# Altium schematic sheet 03_MEDICION.SchDoc: Medición de tensión y corriente
size 420 x 297 mm; Address1: Hardware en IoT · 2026; SheetNumber: 3; SheetTotal: 6
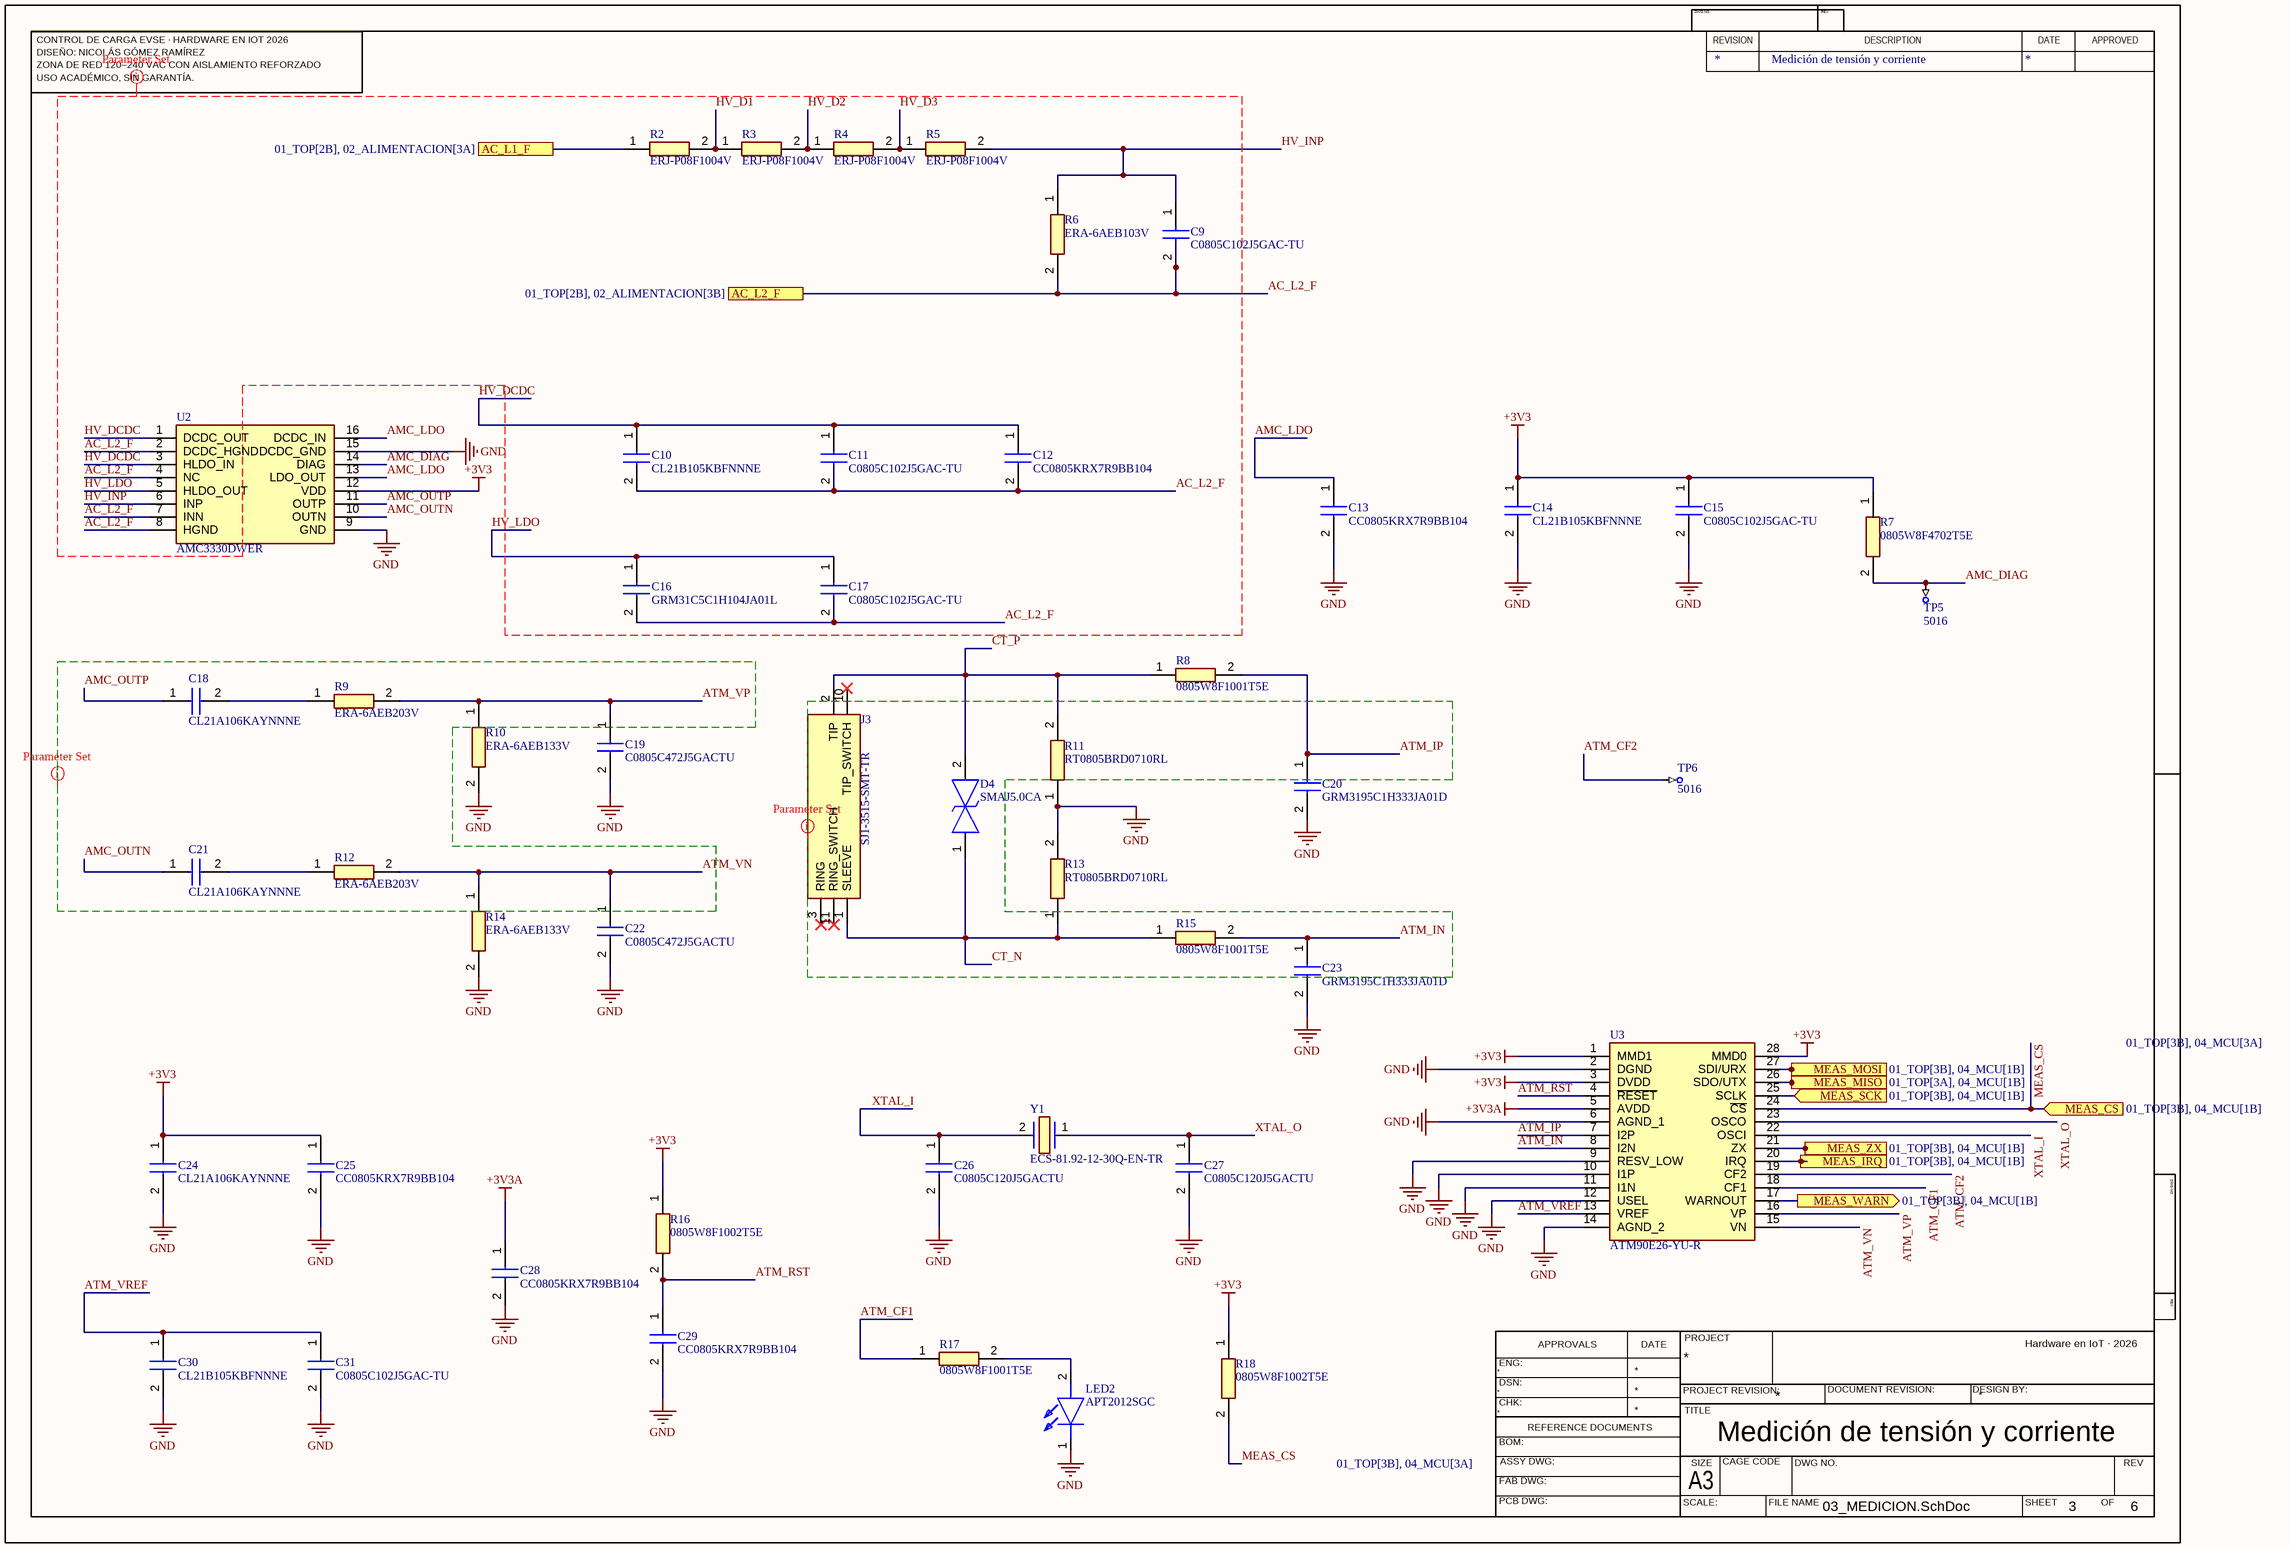
[diagram p0: 03_MEDICION.SchDoc]

## Parts
C9  C0805C102J5GAC-TU  [CAPC2012X88N]
C10  CL21B105KBFNNNE  [CAPC2012X88N]
C11  C0805C102J5GAC-TU  [CAPC2012X88N]
C12  CC0805KRX7R9BB104  [CAPC2012X88N]
C13  CC0805KRX7R9BB104  [CAPC2012X88N]
C14  CL21B105KBFNNNE  [CAPC2012X88N]
C15  C0805C102J5GAC-TU  [CAPC2012X88N]
C16  GRM31C5C1H104JA01L  [CAPC3216X180N]
C17  C0805C102J5GAC-TU  [CAPC2012X88N]
C18  CL21A106KAYNNNE  [CAPC2012X145N]
C19  C0805C472J5GACTU  [CAPC2012X88N]
C20  GRM3195C1H333JA01D  [CAPC3216X180N]
C21  CL21A106KAYNNNE  [CAPC2012X145N]
C22  C0805C472J5GACTU  [CAPC2012X88N]
C23  GRM3195C1H333JA01D  [CAPC3216X180N]
C24  CL21A106KAYNNNE  [CAPC2012X145N]
C25  CC0805KRX7R9BB104  [CAPC2012X88N]
C26  C0805C120J5GACTU  [CAPC2012X88N]
C27  C0805C120J5GACTU  [CAPC2012X88N]
C28  CC0805KRX7R9BB104  [CAPC2012X88N]
C29  CC0805KRX7R9BB104  [CAPC2012X88N]
C30  CL21B105KBFNNNE  [CAPC2012X88N]
C31  C0805C102J5GAC-TU  [CAPC2012X88N]
D4  SMAJ5.0CA  [DIONM5026X229N]
J3  SJ1-3515-SMT-TR  [SJ13515SMTTR]
LED2  APT2012SGC  [LEDC2012X85N]
R2  ERJ-P08F1004V  [ERJP08_(1206)]
R3  ERJ-P08F1004V  [ERJP08_(1206)]
R4  ERJ-P08F1004V  [ERJP08_(1206)]
R5  ERJ-P08F1004V  [ERJP08_(1206)]
R6  ERA-6AEB103V  [RESC2012X60N]
R7  0805W8F4702T5E  [RESC2012X60N]
R8  0805W8F1001T5E  [RESC2012X60N]
R9  ERA-6AEB203V  [RESC2012X60N]
R10  ERA-6AEB133V  [RESC2012X60N]
R11  RT0805BRD0710RL  [RESC2012X60N]
R12  ERA-6AEB203V  [RESC2012X60N]
R13  RT0805BRD0710RL  [RESC2012X60N]
R14  ERA-6AEB133V  [RESC2012X60N]
R15  0805W8F1001T5E  [RESC2012X60N]
R16  0805W8F1002T5E  [RESC2012X60N]
R17  0805W8F1001T5E  [RESC2012X60N]
R18  0805W8F1002T5E  [RESC2012X60N]
TP5  5016  [KEYSTONE-5016_V]
TP6  5016  [KEYSTONE-5016_V]
U2  AMC3330DWER  [SOIC127P1030X265-16N]
U3  ATM90E26-YU-R  [SOP65P778X199-28N]
Y1  ECS-81.92-12-30Q-EN-TR  [ECS81921230QENTR]

## Ports
AC_L1_F (see 01_TOP[2B], 02_ALIMENTACION[3A]), AC_L2_F (see 01_TOP[2B], 02_ALIMENTACION[3B]), MEAS_CS (in, see 01_TOP[3B], 04_MCU[1B]), MEAS_IRQ (out, see 01_TOP[3B], 04_MCU[1B]), MEAS_MISO (out, see 01_TOP[3A], 04_MCU[1B]), MEAS_MOSI (in, see 01_TOP[3B], 04_MCU[1B]), MEAS_SCK (in, see 01_TOP[3B], 04_MCU[1B]), MEAS_WARN (out, see 01_TOP[3B], 04_MCU[1B]), MEAS_ZX (out, see 01_TOP[3B], 04_MCU[1B])

## Nets
+3V3: C14.1 C15.1 C24.1 C25.1 R7.1 R16.1 R18.1 U2.12(VDD) U3.1(MMD1) U3.3(DVDD) U3.28(MMD0)
+3V3A: C28.1 U3.5(AVDD)
GND: C13.2 C14.2 C15.2 C19.2 C20.2 C22.2 C23.2 C24.2 C25.2 C26.2 C27.2 C28.2 C29.2 C30.2 C31.2 LED2.1(K) R10.2 R11.1 R13.2 R14.2 U2.9(GND) U2.15(DCDC_GND) U3.2(DGND) U3.6(AGND_1) U3.9(RESV_LOW) U3.10(I1P) U3.11(I1N) U3.12(USEL) U3.14(AGND_2)
AC_L1_F: R2.1 ; port AC_L1_F
AC_L2_F: C9.2 C10.2 C11.2 C12.2 C16.2 C17.2 R6.2 U2.2(DCDC_HGND) U2.4(NC) U2.7(INN) U2.8(HGND) ; port AC_L2_F
AMC_DIAG: R7.2 TP5.1 U2.14(DIAG)
AMC_LDO: C13.1 U2.13(LDO_OUT) U2.16(DCDC_IN)
AMC_OUTN: C21.1 U2.10(OUTN)
AMC_OUTP: C18.1 U2.11(OUTP)
ATM_CF1: R17.1 U3.18(CF1)
ATM_CF2: TP6.1 U3.19(CF2)
ATM_IN: C23.1 R15.2 U3.8(I2N)
ATM_IP: C20.1 R8.2 U3.7(I2P)
ATM_RST: C29.1 R16.2 U3.4(~{RESET})
ATM_VN: C22.1 R12.2 R14.1 U3.15(VN)
ATM_VP: C19.1 R9.2 R10.1 U3.16(VP)
ATM_VREF: C30.1 C31.1 U3.13(VREF)
CT_N: D4.1 J3.1(SLEEVE) R13.1 R15.1
CT_P: D4.2 J3.2(TIP) R8.1 R11.2
HV_D1: R2.2 R3.1
HV_D2: R3.2 R4.1
HV_D3: R4.2 R5.1
HV_DCDC: C10.1 C11.1 C12.1 U2.1(DCDC_OUT) U2.3(HLDO_IN)
HV_INP: C9.1 R5.2 R6.1 U2.6(INP)
HV_LDO: C16.1 C17.1 U2.5(HLDO_OUT)
MEAS_CS: R18.2 U3.24(~{CS}) ; port MEAS_CS
MEAS_IRQ: U3.20(IRQ) ; port MEAS_IRQ
MEAS_MISO: U3.26(SDO/UTX) ; port MEAS_MISO
MEAS_MOSI: U3.27(SDI/URX) ; port MEAS_MOSI
MEAS_SCK: U3.25(SCLK) ; port MEAS_SCK
MEAS_WARN: U3.17(WARNOUT) ; port MEAS_WARN
MEAS_ZX: U3.21(ZX) ; port MEAS_ZX
XTAL_I: C26.1 U3.22(OSCI) Y1.2(OUT/IN)
XTAL_O: C27.1 U3.23(OSCO) Y1.1(IN/OUT)
NetC18_2: C18.2 R9.1
NetC21_2: C21.2 R12.1
NetLED2_2: LED2.2(A) R17.2

Not connected (* = marked no-connect by the designer): J3 3(RING)* 10(TIP_SWITCH)* 11(RING_SWITCH)*

## Layout directives
net class HV_AC: AC_L2_F, HV_D1, HV_D2, HV_D3, HV_DCDC, HV_INP, HV_LDO
net class ANALOG: AMC_OUTN, AMC_OUTP, ATM_IN, ATM_IP, ATM_VN, ATM_VP, CT_N

## Notes on the sheet
- CONTROL DE CARGA EVSE · HARDWARE EN IOT 2026
- DISEÑO: NICOLÁS GÓMEZ RAMÍREZ
- DWG NO:
- REVISION
- REV:
- DESCRIPTION
- DATE
- APPROVED
- ZONA DE RED 120–240 VAC CON AISLAMIENTO REFORZADO
- USO ACADÉMICO, SIN GARANTÍA.
- ENG:
- APPROVALS
- PROJECT
- DSN:
- CHK:
- REFERENCE DOCUMENTS
- PROJECT REVISION:
- TITLE
- DOCUMENT REVISION:
- DESIGN BY:
- BOM:
- FAB DWG:
- PCB DWG:
- ASSY DWG:
- SCALE:
- A3
- SIZE
- CAGE CODE
- FILE NAME
- DWG NO.
- SHEET
- OF
- REV

## Library data of the parts
C9 C11 C15 C17 C31 = C0805C102J5GAC-TU: Capacitor; Manufacturer_Name: KEMET; Manufacturer_Part_Number: C0805C102J5GACTU; Assembly: JLCPCB; Value: 1nF 50V C0G; Datasheet Link: https://www.kemet.com/specsheet/C0805C102J5GACTU; Height: 0.88mm; Supplier: JLCPCB; Supplier PN: LCSC C2167084
C10 C14 C30 = CL21B105KBFNNNE: Capacitor 1 uF 50 V X7R 10% 0805; Manufacturer_Name: Samsung Electro-Mechanics; Assembly: JLCPCB; Manufacturer_Part_Number: CL21B105KBFNNNE; Supplier: JLCPCB; Supplier PN: LCSC C28323; Value: 1uF 50V X7R
C12 C13 C25 C28 C29 = CC0805KRX7R9BB104: Capacitor 100 nF 50 V X7R 10% 0805; Manufacturer_Name: YAGEO; Assembly: JLCPCB; Manufacturer_Part_Number: CC0805KRX7R9BB104; Supplier: JLCPCB; Supplier PN: LCSC C49678; Value: 100nF 50V X7R
C16 = GRM31C5C1H104JA01L: Capacitor ceramico 100 nF 50 V C0G 5% 1206; Manufacturer_Name: Murata; Assembly: JLCPCB; Manufacturer_Part_Number: GRM31C5C1H104JA01L; Supplier: JLCPCB; Supplier PN: LCSC C97946; Value: 100nF 50V C0G
C18 C21 C24 = CL21A106KAYNNNE: Capacitor; Manufacturer_Name: Samsung Electro-Mechanics; Assembly: JLCPCB; Value: 10uF 25V; Datasheet Link: https://datasheet.datasheetarchive.com/originals/distributors/Datasheets_SAMA/6a45835c9b7400e9b49c55c38a8ff4a2.pdf; Height: 1.45mm; Manufacturer_Part_Number: CL21A106KAYNNNE; Supplier: JLCPCB; Supplier PN: LCSC C15850
C19 C22 = C0805C472J5GACTU: Capacitor; Manufacturer_Name: KEMET; Assembly: JLCPCB; Value: 4.7nF 50V C0G; Datasheet Link: https://www.kemet.com/specsheet/C0805C472J5GACTU; Height: 0.88mm; Manufacturer_Part_Number: C0805C472J5GACTU; Supplier: JLCPCB; Supplier PN: LCSC C2170898
C20 C23 = GRM3195C1H333JA01D: Capacitor ceramico 33 nF 50 V C0G 5% 1206; Manufacturer_Name: Murata; Assembly: JLCPCB; Manufacturer_Part_Number: GRM3195C1H333JA01D; Supplier: JLCPCB; Supplier PN: LCSC C97930; Value: 33nF 50V C0G
C26 C27 = C0805C120J5GACTU: Capacitor; Manufacturer_Name: KEMET; Assembly: JLCPCB; Value: 12pF 50V C0G; Datasheet Link: https://www.kemet.com/specsheet/C0805C120J5GACTU; Height: 0.88mm; Manufacturer_Part_Number: C0805C120J5GACTU; Supplier: JLCPCB; Supplier PN: LCSC C2168859
D4 = SMAJ5.0CA: TVS Diode (Bi-directional); Manufacturer_Name: Littelfuse; Assembly: JLCPCB; Value: 5V TVS bidir; Datasheet Link: http://www.littelfuse.com/~/media/electronics/datasheets/tvs_diodes/littelfuse_tvs_diode_smaj_datasheet.pdf.pdf; Height: 2.29mm; Manufacturer_Part_Number: SMAJ5.0CA; Supplier: JLCPCB; Supplier PN: LCSC C83324
J3 = SJ1-3515-SMT-TR: Connector; Manufacturer_Name: Same Sky; Assembly: JLCPCB; Value: jack 3.5mm; Datasheet Link: https://www.sameskydevices.com/product/resource/sj1-351x-smt.pdf; Height: 5.3mm; Manufacturer_Part_Number: SJ1-3515-SMT-TR; Supplier: JLCPCB; Supplier PN: LCSC C22359767
LED2 = APT2012SGC: LED; Manufacturer_Name: Kingbright; Assembly: JLCPCB; Value: verde; Datasheet Link: http://www.us.kingbright.com/images/catalog/SPEC/APT2012SGC.pdf; Height: 0.85mm; Manufacturer_Part_Number: APT2012SGC; Supplier: JLCPCB; Supplier PN: LCSC C5353439
R2-R5 = ERJ-P08F1004V: Resistor; Manufacturer_Name: Panasonic; Assembly: JLCPCB; Value: 1M 1206; Datasheet Link: http://industrial.panasonic.com/cdbs/www-data/pdf/RDO0000/AOA0000C331.pdf; Height: 0.7mm; Manufacturer_Part_Number: ERJ-P08F1004V; Supplier: JLCPCB; Supplier PN: LCSC C41369755
R6 = ERA-6AEB103V: Resistor; Manufacturer_Name: Panasonic; Value: 10k 0.1%; Assembly: JLCPCB; Height: 0.55mm; Manufacturer_Part_Number: ERA-6AEB103V; Supplier: JLCPCB; Supplier PN: LCSC C191101
R7 = 0805W8F4702T5E: Resistor 47 kOhm 1% 125 mW 0805; Manufacturer_Name: UNI-ROYAL; Value: 47k; Assembly: JLCPCB; Manufacturer_Part_Number: 0805W8F4702T5E; Supplier: JLCPCB; Supplier PN: LCSC C17713
R8 R15 R17 = 0805W8F1001T5E: Resistor 1 kOhm 1% 125 mW 0805; Manufacturer_Name: UNI-ROYAL; Assembly: JLCPCB; Value: 1k; Manufacturer_Part_Number: 0805W8F1001T5E; Supplier: JLCPCB; Supplier PN: LCSC C17513
R9 R12 = ERA-6AEB203V: Resistor; Manufacturer_Name: Panasonic; Value: 20k 0.1%; Assembly: JLCPCB; Height: 0.55mm; Manufacturer_Part_Number: ERA-6AEB203V; Supplier: JLCPCB; Supplier PN: LCSC C473304
R10 R14 = ERA-6AEB133V: Resistor; Manufacturer_Name: Panasonic; Value: 13k 0.1%; Assembly: JLCPCB; Height: 0.55mm; Manufacturer_Part_Number: ERA-6AEB133V; Supplier: JLCPCB; Supplier PN: LCSC C445658
R11 R13 = RT0805BRD0710RL: Resistencia de pelicula delgada 10 ohm 0.1% 25 ppm 0805; Manufacturer_Name: Yageo; Value: 10R 0.1%; Assembly: JLCPCB; Manufacturer_Part_Number: RT0805BRD0710RL; Supplier: JLCPCB; Supplier PN: LCSC C865142
R16 R18 = 0805W8F1002T5E: Resistor 10 kOhm 1% 125 mW 0805; Manufacturer_Name: UNI-ROYAL; Value: 10k; Assembly: JLCPCB; Manufacturer_Part_Number: 0805W8F1002T5E; Supplier: JLCPCB; Supplier PN: LCSC C17414
TP5 TP6 = CMP-2000-05178-1: Test Point, 1-Pin SMT, RoHS, Tape and Reel; Manufacturer: Keystone; Manufacturer_Name: ronghe; Manufacturer_Part_Number: RH-5016; Other Names: 5016KDKR; Featured Product: SurfaceMountTestPoints / 5019MiniatureSurfaceMountTestPoint; Online Catalog: SurfaceMountTestPoints; Catalog Drawings: 5016Top / 5016Side / 5016Front; Value: TP; Assembly: JLCPCB; Packaging: Digi-Reel; RoHS Information: RoHSComplianceStatement; Package Reference: 5016; Mounting Type: SurfaceMount; Type: PCTestPoint,Compact; Manufacturer URL: http://www.keyelco.com/; Standard Package: 1; Package Description: 1-Pin Test Point, Body 3.81 x 2.04 mm; Category: TestandMeasurement; Terminal: 0.015"(0.38mm)PhosphorBronze,SilverPlated; Datasheet URL: https://ciiva.com/datasheet-click-2917613?src=ciiva&sig=4a4e90f; Datasheet Version: Rev. D, 03/2014; Family: TestPoints; Material: PhosphorBronze; Supplier: JLCPCB; Supplier PN: LCSC C5199799
U2 = AMC3330DWER: Amplificador aislado +-1 V con DC/DC integrado, aislamiento reforzado, SOIC-16 DWE (carrete); Manufacturer_Name: Texas Instruments; Assembly: JLCPCB; Value: ±1V iso amp; Manufacturer_Part_Number: AMC3330DWER; Supplier: JLCPCB; Supplier PN: LCSC C2999368
U3 = ATM90E26-YU-R: Integrated Circuit; Manufacturer_Name: Microchip; Assembly: JLCPCB; Value: energy meter; Datasheet Link: http://ww1.microchip.com/downloads/en/DeviceDoc/Atmel-46002-SE-M90E26-Datasheet.pdf; Height: 1.99mm; Manufacturer_Part_Number: ATM90E26-YU-R; Supplier: JLCPCB; Supplier PN: LCSC C616398
Y1 = ECS-81.92-12-30Q-EN-TR: Crystal or Oscillator; Manufacturer_Name: ECS; Assembly: JLCPCB; Value: 8.192MHz 12pF; Datasheet Link: https://datasheet.datasheetarchive.com/originals/distributors/Datasheets_SAMA/a25c19192314839168edce8dcea0d59f.pdf; Height: 1.1mm; Manufacturer_Part_Number: ECS-81.92-12-30Q-EN-TR; Supplier: JLCPCB; Supplier PN: LCSC C2450755